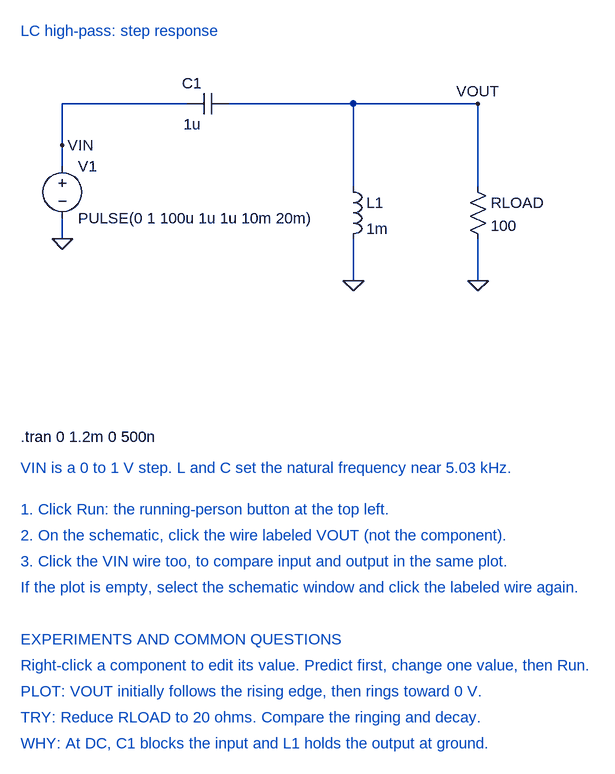
[diagram p0: schematic 15-lc-high-pass-step.asc]
15-lc-high-pass-step.asc, the LTspice schematic file:
Version 4
SHEET 1 1200 1400
WIRE 128 208 128 240
WIRE 128 320 128 352
WIRE 128 208 128 144
WIRE 128 144 320 144
WIRE 384 144 768 144
WIRE 576 144 576 272
WIRE 576 352 576 416
WIRE 768 144 768 272
WIRE 768 352 768 416
FLAG 128 208 VIN
FLAG 128 352 0
FLAG 576 416 0
FLAG 768 144 VOUT
FLAG 768 416 0
SYMBOL voltage 128 224 R0
SYMATTR InstName V1
SYMATTR Value PULSE(0 1 100u 1u 1u 10m 20m)
SYMBOL cap 384 128 R90
WINDOW 0 0 56 VBottom 2
WINDOW 3 32 56 VTop 2
SYMATTR InstName C1
SYMATTR Value 1u
SYMBOL ind 560 256 R0
SYMATTR InstName L1
SYMATTR Value 1m
SYMBOL res 752 256 R0
SYMATTR InstName RLOAD
SYMATTR Value 100
TEXT 64 32 Left 2 ;LC high-pass: step response
TEXT 64 656 Left 2 !.tran 0 1.2m 0 500n
TEXT 64 704 Left 2 ;VIN is a 0 to 1 V step. L and C set the natural frequency near 5.03 kHz.
TEXT 64 768 Left 2 ;1. Click Run: the running-person button at the top left.
TEXT 64 808 Left 2 ;2. On the schematic, click the wire labeled VOUT (not the component).
TEXT 64 848 Left 2 ;3. Click the VIN wire too, to compare input and output in the same plot.
TEXT 64 888 Left 2 ;If the plot is empty, select the schematic window and click the labeled wire again.
TEXT 64 968 Left 2 ;EXPERIMENTS AND COMMON QUESTIONS
TEXT 64 1008 Left 2 ;Right-click a component to edit its value. Predict first, change one value, then Run.
TEXT 64 1048 Left 2 ;PLOT: VOUT initially follows the rising edge, then rings toward 0 V.
TEXT 64 1088 Left 2 ;TRY: Reduce RLOAD to 20 ohms. Compare the ringing and decay.
TEXT 64 1128 Left 2 ;WHY: At DC, C1 blocks the input and L1 holds the output at ground.

The netlist it stands for:
* 15-lc-high-pass-step.asc
V1 VIN 0 PULSE(0 1 100u 1u 1u 10m 20m)
C1 VOUT VIN 1u
L1 VOUT 0 1m
RLOAD VOUT 0 100
* LC high-pass: step response
.tran 0 1.2m 0 500n
* VIN is a 0 to 1 V step. L and C set the natural frequency near 5.03 kHz.
* 1. Click Run: the running-person button at the top left.
* 2. On the schematic, click the wire labeled VOUT (not the component).
* 3. Click the VIN wire too, to compare input and output in the same plot.
* If the plot is empty, select the schematic window and click the labeled wire again.
* EXPERIMENTS AND COMMON QUESTIONS
* Right-click a component to edit its value. Predict first, change one value, then Run.
* PLOT: VOUT initially follows the rising edge, then rings toward 0 V.
* TRY: Reduce RLOAD to 20 ohms. Compare the ringing and decay.
* WHY: At DC, C1 blocks the input and L1 holds the output at ground.
.backanno
.end